# Altium schematic sheet BACKUP_Power.SchDoc
size A3; SheetNumber: 11; SheetTotal: 16
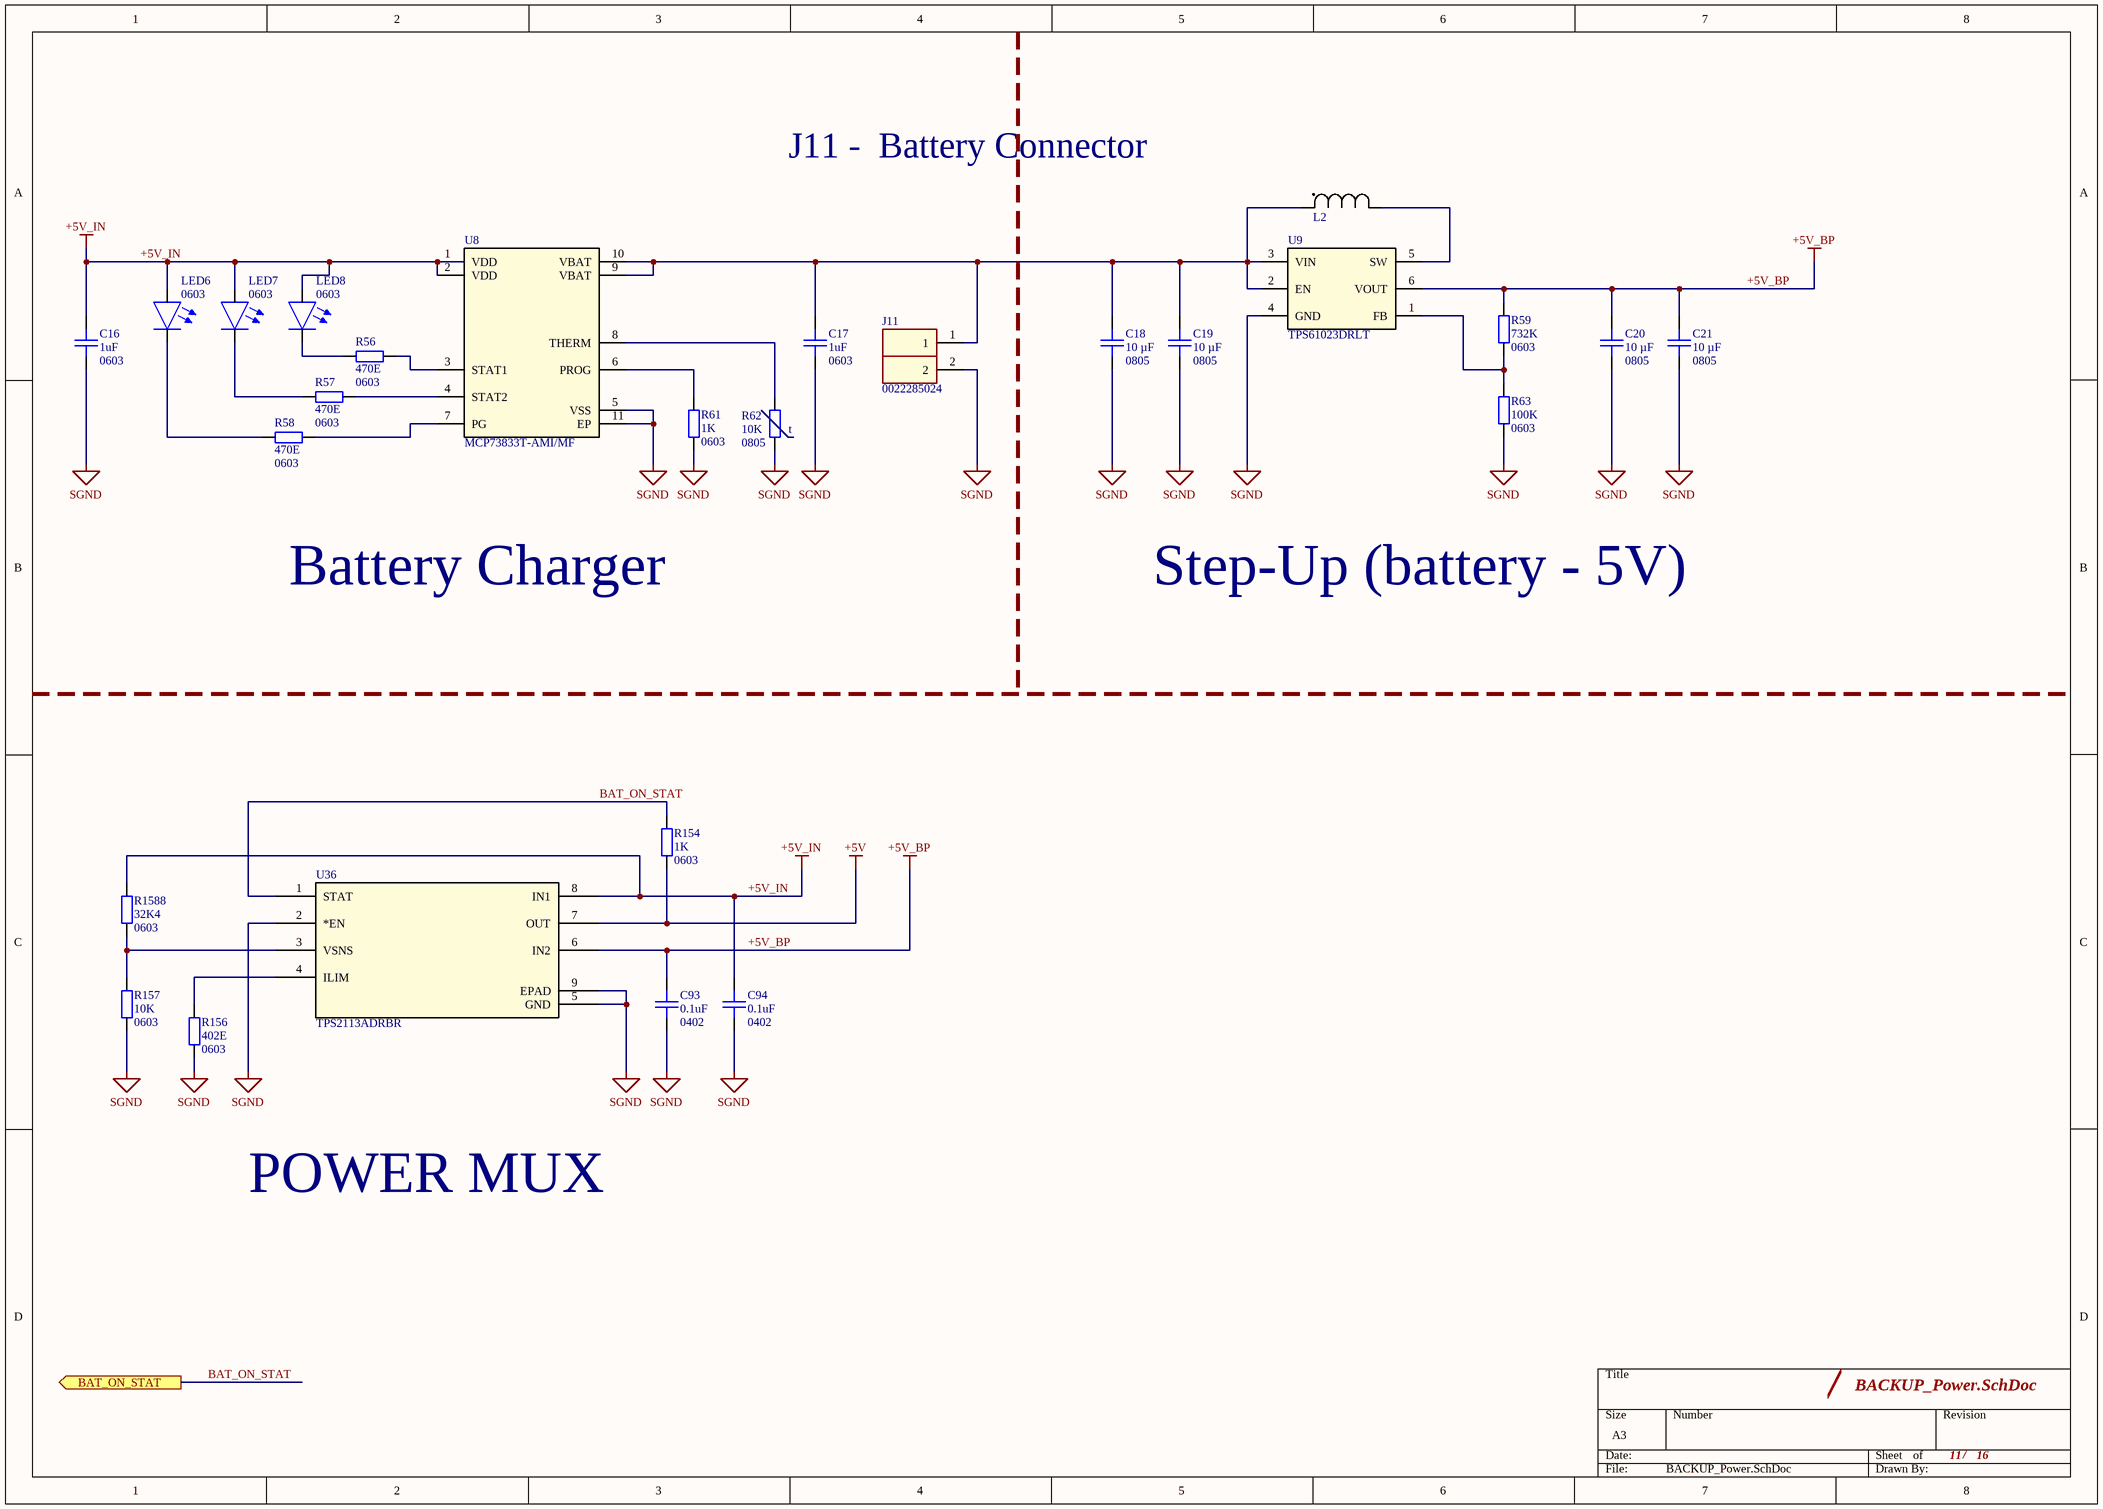
[diagram p0: BACKUP_Power.SchDoc]

## Parts
C16  Capacitance: 1uF  Size2: 0603  [CAPC160X80X90L35]  (hidden comment: KGM15AR71C105KT)
C17  Capacitance: 1uF  Size2: 0603  [CAPC160X80X90L35]  (hidden comment: KGM15AR71C105KT)
C18  Capacitance: 10 µF  Size2: 0805  [CAPC200X125X125L50]  (hidden comment: CC0805KKX5R8BB106)
C19  Capacitance: 10 µF  Size2: 0805  [CAPC200X125X125L50]  (hidden comment: CC0805KKX5R8BB106)
C20  Capacitance: 10 µF  Size2: 0805  [CAPC200X125X125L50]  (hidden comment: CC0805KKX5R8BB106)
C21  Capacitance: 10 µF  Size2: 0805  [CAPC200X125X125L50]  (hidden comment: CC0805KKX5R8BB106)
C93  Capacitance: 0.1uF  Package1: 0402  [CAPC100x50x50L25]  (hidden comment: 04023C104KAT2A)
C94  Capacitance: 0.1uF  Package1: 0402  [CAPC100x50x50L25]  (hidden comment: 04023C104KAT2A)
J11  0022285024  [PLS-02]
L2  XEL4030-101MEB  [IND_XEL4030_3.2_COC]  (value not drawn)
LED6  Size: 0603  [LED_0603(1608)]  (hidden comment: 150060GS75000)
LED7  Size: 0603  [LED_0603(1608)]  (hidden comment: 150060GS75000)
LED8  Size: 0603  [LED_0603(1608)]  (hidden comment: 150060GS75000)
R56  Resistance: 470E  Size2: 0603  [RESC160X80X55L30]  (hidden comment: RC0603FR-07470RL)
R57  Resistance: 470E  Size2: 0603  [RESC160X80X55L30]  (hidden comment: RC0603FR-07470RL)
R58  Resistance: 470E  Size2: 0603  [RESC160X80X55L30]  (hidden comment: RC0603FR-07470RL)
R59  Resistance: 732K  Size2: 0603  [RESC160X80X55L30]  (hidden comment: RC0603FR-07732KL)
R61  Resistance: 1K  Size2: 0603  [RESC160X80X55L30]  (hidden comment: RC0603FR-071KL)
R62  Resistance: 10K  Size2: 0805  [RESC200X125X60L40]  (hidden comment: NTCS0805E3103HMT)
R63  Resistance: 100K  Size2: 0603  [RESC160X80X55L30]  (hidden comment: RC0603FR-07100KL)
R154  Resistance: 1K  Size2: 0603  [RESC160X80X55L30]  (hidden comment: RC0603FR-071KL)
R156  Resistance: 402E  Size2: 0603  [RESC160X80X55L30]  (hidden comment: RC0603FR-07402RP)
R157  Resistance: 10K  Size2: 0603  [RESC160X80X55L30]  (hidden comment: RC0603FR-0710KL)
R1588  Resistance: 32K4  Size2: 0603  [RESC160X80X55L30]  (hidden comment: RC0603FR-0732K4L)
U8  MCP73833T-AMI/MF  [DFN10_3x3MC_MCH]
U9  TPS61023DRLT  [DRL0006A]
U36  TPS2113ADRBR  [DRB8_2P4X1P65]

## Ports
BAT_ON_STAT (out)

## Nets
+5V: R154.2 U36.7(OUT)
+5V_BP: C20.2 C21.2 C93.1 R59.1 U9.6(VOUT) U36.6(IN2)
+5V_IN: C16.2 C94.1 LED6.1(Anode) LED7.1(Anode) LED8.1(Anode) R1588.1 U8.1(VDD) U8.2(VDD) U36.8(IN1)
SGND: C16.1 C17.1 C18.1 C19.1 C20.1 C21.1 C93.2 C94.2 J11.2 R61.2 R62.1 R63.2 R156.2 R157.2 U8.5(VSS) U8.11(EP) U9.4(GND) U36.2(*EN) U36.5(GND) U36.9(EPAD)
BAT_ON_STAT: R154.1 U36.1(STAT) ; port BAT_ON_STAT
NetC17_2: C17.2 C18.2 C19.2 J11.1 L2.2 U8.9(VBAT) U8.10(VBAT) U9.2(EN) U9.3(VIN)
NetL2_1: L2.1 U9.5(SW)
NetLED6_2: LED6.2(Chatode) R58.2
NetLED7_2: LED7.2(Chatode) R57.2
NetLED8_2: LED8.2(Chatode) R56.2
NetR56_1: R56.1 U8.3(STAT1)
NetR57_1: R57.1 U8.4(STAT2)
NetR58_1: R58.1 U8.7(PG)
NetR59_2: R59.2 R63.1 U9.1(FB)
NetR61_1: R61.1 U8.6(PROG)
NetR62_2: R62.2 U8.8(THERM)
NetR156_1: R156.1 U36.4(ILIM)
NetR157_1: R157.1 R1588.2 U36.3(VSNS)

## Notes on the sheet
- J11 -  Battery Connector
- (near R62) t
- Battery Charger
- Step-Up (battery - 5V)
- POWER MUX
- /

## Library data of the parts
C16 C17 = CMP-00119-5: CAP CER 1UF 16V X7R 0603; Manufacturer: KYOCERA AVX; Op Temp min: -55°C; Op Temp max: 125°C; Tolerance: 10%; ComponentLink3URL: https://www.digikey.ee/en/products/detail/kyocera-avx/kgm15ar71c105kt/10815111; ComponentLink1Description: Datasheet; MPN: KGM15AR71C105KT; Lead Spacing: 0mm; Ratings: -; Size: 1.60mm x 0.80mm; ComponentLink1URL: https://datasheets.kyocera-avx.com/KGM_X7R.pdf; Package: 0603 (1608 Metric); Dielectric: X7R; ComponentLink3Description: Digikey; Voltage Rating: 16V; Height max: 900µm; Mounting Type: SM; Component Type: Ceramic Capacitor
C18-C21 = CMP-001-1415-2: CAP CER 10UF 25V X5R 0805; Manufacturer: YAGEO; Op Temp max: 125°C; Op Temp min: -55°C; Tolerance: ±10%; Voltage Rating: 25V; Mounting Type: SM; MPN: CC0805KKX5R8BB106; Package: 0805 (2012 Metric); Dielectric: X5R; ComponentLink3Description: Digikey; ComponentLink1Description: Datasheet; Component Type: Ceramic Capacitor
  C18 C20: ComponentLink1URL: https://www.yageo.com/upload/media/product/app/datasheet/mlcc/upy-gphc_x7r_6_3v-to-250v.pdf; ComponentLink3URL: https://www.digikey.ee/en/products/detail/yageo/cc0805krx7r9bb223/302872
  C19 C21: ComponentLink1URL: https://www.yageo.com/upload/media/product/app/datasheet/mlcc/upy-gphc_x5r_4v-to-50v.pdf; ComponentLink3URL: https://www.digikey.com/en/products/detail/yageo/CC0805KKX5R8BB106/5195275
C93 C94 = CMP-001-0374-4: 0402 25V X7R 100 NF 10%; Manufacturer: KYOCERA AVX; Op Temp max: 85°C; Op Temp min: -55°C; ComponentLink3URL: https://www.digikey.com/en/products/detail/yageo/CC0402MRX5R5BB106/5195138; MPN: 04023C104KAT2A; ComponentLink1URL: https://www.yageo.com/upload/media/product/productsearch/datasheet/mlcc/UPY-GPHC_X5R_4V-to-50V_26.pdf; Package: 0402 (1005 Metric); Size: 1.00mm x 0.50mm; Height max: 700µm; Mounting Type: SM; Tolerance: 10%; ComponentLink1Description: Datasheet; ComponentLink3Description: Digikey; Ratings: -; Dielectric: X7R; ComponentLink2Description: Mouser; ComponentLink2URL: https://eu.mouser.com/ProductDetail/YAGEO/CC0402MRX5R5BB106?qs=zEY9bCHj09eCmUJdZuS5Lg%3D%3D; Lead Spacing: 0mm; Component Type: Ceramic Capacitor; Voltage Rating: 25V
J11 = PLS_02: CONN HEADER VERT 2POS 2.54MM; MAnufacturer: MOLEX; MPN: 0022285024
L2 = XEL4030-101MEB: FIXED IND 1UH 10.7A 9.78MOHM SM; Mfr_Name: Coilcraft; Tolerance: ±20%; Inductance: 1 µH; DC Resistance (DCR): 9.78mOhm Max; Current Rating (Amps): 10.7 A; MPN: XEL4030-101MEB; ComponentLink1Description: DigiKey; ComponentLink1URL: https://www.digikey.com/en/products/detail/coilcraft/xel4030-102mec/21381728; ComponentLink2Description: Datasheet; ComponentLink2URL: https://www.coilcraft.com/en-us/files/datasheet/XEL4030
LED6-LED8 = LED_0603_SMD: LED GREEN CLEAR 0603 SMD; MPN: 150060GS75000; ComponentLink1Description: DigiKey; ComponentLink1URL: https://www.digikey.com/en/products/detail/w%C3%BCrth-elektronik/150060gs75000/4489898
R56-R58 = CMP-001-0628-7: RES 470 OHM 1% 1/10W 0603; Manufacturer: YAGEO; Power: 100mW; Temperature Coefficient: ±100ppm; Op Temp max: 155°C; Op Temp min: -55°C; Ratings: -; ComponentLink3URL: https://www.digikey.com/en/products/detail/yageo/RC0603FR-0710KL/726880?s=N4IgTCBcDaIEoGEAMA2JBmAYnAtEg7AIxIDSAMiALoC%2BQA; Size: 1.60mm x 0.80mm; ComponentLink1Description: Datasheet; ComponentLink3Description: Digikey; ComponentLink2Description: Mouser; ComponentLink1URL: https://www.yageo.com/upload/media/product/products/datasheet/rchip/PYu-RC_51_RoHS_P_4.pdf; Composition: Thick Film; Package: 0603 (1608 Metric); ComponentLink2URL: https://eu.mouser.com/ProductDetail/YAGEO/RC0603FR-0710KL?qs=grNVn54RoB%252B3GtjbJj3wJQ%3D%3D; Mounting Type: SM; Tolerance: 1%; Height max: 550µm; MPN: RC0603FR-07470RL; Component Type: Chip Resistor
R59 = CMP-001-0628-7: RES 732K OHM 1% 1/10W 0603; Manufacturer: YAGEO; Power: 100mW; Temperature Coefficient: ±100ppm; Op Temp max: 155°C; Op Temp min: -55°C; Ratings: -; ComponentLink3URL: https://www.digikey.com/en/products/detail/yageo/rc0603fr-07732kl/727376; Size: 1.60mm x 0.80mm; ComponentLink1Description: Datasheet; ComponentLink3Description: Digikey; ComponentLink1URL: https://www.digikey.ee/en/products/detail/yageo/rc0603fr-07100rp/4935304; Composition: Thick Film; Package: 0603 (1608 Metric); Mounting Type: SM; Tolerance: 1%; Height max: 550µm; MPN: RC0603FR-07732KL; Component Type: Chip Resistor
R61 R154 = CMP-001-0628-7: RES 1K OHM 1% 1/10W 0603; Manufacturer: YAGEO; Power: 100mW; Temperature Coefficient: ±100ppm; Op Temp max: 155°C; Op Temp min: -55°C; Ratings: -; ComponentLink3URL: https://www.digikey.com/en/products/detail/yageo/RC0603FR-0710KL/726880?s=N4IgTCBcDaIEoGEAMA2JBmAYnAtEg7AIxIDSAMiALoC%2BQA; Size: 1.60mm x 0.80mm; ComponentLink1Description: Datasheet; ComponentLink3Description: Digikey; ComponentLink1URL: https://www.digikey.ee/en/products/detail/yageo/rc0603fr-07100rp/4935304; Composition: Thick Film; Package: 0603 (1608 Metric); Mounting Type: SM; Tolerance: 1%; Height max: 550µm; MPN: RC0603FR-071KL; Component Type: Chip Resistor
R62 = CMP-001-0694-4: THERMISTOR NTC 10KOHM 3570K 0805; Manufacturer: Vishay Beyschlag/Draloric/BC Components; Op Temp max: 155°C; Tolerance: ±3%; Package: 0805 (2012 Metric); MPN: NTCS0805E3103HMT; ComponentLink1Description: Datasheet; ComponentLink3Description: Digikey; Mounting Type: SM; ComponentLink3URL: https://www.digikey.com/en/products/detail/vishay-beyschlag-draloric-bc-components/ntcs0805e3103hmt/2237369; ComponentLink1URL: https://www.vishay.com/docs/29044/ntcs0805e3t.pdf; Component Type: Chip Resistor
R63 = CMP-001-0628-7: RES 100K OHM 1% 1/10W 0603; Manufacturer: YAGEO; Power: 100mW; Temperature Coefficient: ±100ppm; Op Temp max: 155°C; Op Temp min: -55°C; Ratings: -; ComponentLink3URL: https://www.digikey.com/en/products/detail/yageo/rc0603fr-07100kl/726889; Size: 1.60mm x 0.80mm; ComponentLink1Description: Datasheet; ComponentLink3Description: Digikey; ComponentLink1URL: https://www.digikey.ee/en/products/detail/yageo/rc0603fr-07100rp/4935304; Composition: Thick Film; Package: 0603 (1608 Metric); Mounting Type: SM; Tolerance: 1%; Height max: 550µm; MPN: RC0603FR-07100KL; Component Type: Chip Resistor
R156 = CMP-001-0628-7: RES 402 OHM 1% 1/10W 0603; Manufacturer: YAGEO; Power: 100mW; Temperature Coefficient: ±100ppm; Op Temp max: 155°C; Op Temp min: -55°C; PMNT: DNP; Ratings: -; ComponentLink3URL: https://www.digikey.com/en/products/detail/yageo/RC0603FR-0710KL/726880?s=N4IgTCBcDaIEoGEAMA2JBmAYnAtEg7AIxIDSAMiALoC%2BQA; Size: 1.60mm x 0.80mm; ComponentLink1Description: Datasheet; ComponentLink3Description: Digikey; ComponentLink2Description: Mouser; ComponentLink1URL: https://www.yageo.com/upload/media/product/products/datasheet/rchip/PYu-RC_51_RoHS_P_4.pdf; Composition: Thick Film; Package: 0603 (1608 Metric); ComponentLink2URL: https://eu.mouser.com/ProductDetail/YAGEO/RC0603FR-0710KL?qs=grNVn54RoB%252B3GtjbJj3wJQ%3D%3D; Mounting Type: SM; Tolerance: 1%; Height max: 550µm; MPN: RC0603FR-07402RP; Component Type: Chip Resistor
R157 = CMP-001-0628-7: RES 10K OHM 1% 1/10W 0603; Manufacturer: YAGEO; Power: 100mW; Temperature Coefficient: ±100ppm; Op Temp max: 155°C; Op Temp min: -55°C; PMNT: DNP; Ratings: -; ComponentLink3URL: https://www.digikey.com/en/products/detail/yageo/RC0603FR-0710KL/726880?s=N4IgTCBcDaIEoGEAMA2JBmAYnAtEg7AIxIDSAMiALoC%2BQA; Size: 1.60mm x 0.80mm; ComponentLink1Description: Datasheet; ComponentLink3Description: Digikey; ComponentLink2Description: Mouser; ComponentLink1URL: https://www.yageo.com/upload/media/product/products/datasheet/rchip/PYu-RC_51_RoHS_P_4.pdf; Composition: Thick Film; Package: 0603 (1608 Metric); ComponentLink2URL: https://eu.mouser.com/ProductDetail/YAGEO/RC0603FR-0710KL?qs=grNVn54RoB%252B3GtjbJj3wJQ%3D%3D; Mounting Type: SM; Tolerance: 1%; Height max: 550µm; MPN: RC0603FR-0710KL; Component Type: Chip Resistor
R1588 = CMP-001-0628-7: RES 32.4K OHM 1% 1/10W 0603; Manufacturer: YAGEO; Power: 100mW; Temperature Coefficient: ±100ppm; Op Temp max: 155°C; Op Temp min: -55°C; PMNT: DNP; Ratings: -; ComponentLink3URL: https://www.digikey.com/en/products/detail/yageo/RC0603FR-0710KL/726880?s=N4IgTCBcDaIEoGEAMA2JBmAYnAtEg7AIxIDSAMiALoC%2BQA; Size: 1.60mm x 0.80mm; ComponentLink1Description: Datasheet; ComponentLink3Description: Digikey; ComponentLink2Description: Mouser; ComponentLink1URL: https://www.yageo.com/upload/media/product/products/datasheet/rchip/PYu-RC_51_RoHS_P_4.pdf; Composition: Thick Film; Package: 0603 (1608 Metric); ComponentLink2URL: https://eu.mouser.com/ProductDetail/YAGEO/RC0603FR-0710KL?qs=grNVn54RoB%252B3GtjbJj3wJQ%3D%3D; Mounting Type: SM; Tolerance: 1%; Height max: 550µm; MPN: RC0603FR-0732K4L; Component Type: Chip Resistor
U8 = MCP73833T-AMIMF: IC BATT CONTRL LI-ION 1CEL 10DFN; Mfr_Name: Microchip; Voltage - Supply (Max): 6V; Battery Pack Voltage: 4.2V; Charge Current - Max: 1.1A; MPN: MCP73833T-AMI/MF
U9 = TPS61023DRLT: IC REG BOOST ADJ 3A SOT563; Mfr_Name: Texas Instruments; Voltage - Input (Min): 0.5V; Voltage - Input (Max): 5.5V; Frequency - Switching: 1MHz; Current - Output: 3A; Manufacturer_Part_Number: TPS61023DRLT; ComponentLink1Description: DigiKey; ComponentLink1URL: https://www.digikey.com/en/products/detail/texas-instruments/tps61023drlt/11310622; ComponentLink2Description: Datasheet; ComponentLink2URL: https://www.ti.com/general/docs/suppproductinfo.tsp?distId=10&gotoUrl=https%3A%2F%2Fwww.ti.com%2Flit%2Fgpn%2Ftps61023
U36 = TPS2113ADRBR: IC OR CTRLR SRC SELECT 8SON; Mfr_Name: Texas Instruments; Current - Output (Max): 1.25A; Voltage - Supply: 2.8V ~ 5.5V; MPN: TPS2113ADRBR; Type: Source Selector Switch; ComponentLink1Description: DigiKey; ComponentLink1URL: https://www.digikey.com/en/products/detail/texas-instruments/TPS2113ADRBR/2353703?s=N4IgTCBcDaICoAUDKYCMqDMBBAIgJQCE8QBdAXyA; ComponentLink2Description: Datasheet; ComponentLink2URL: https://www.ti.com/general/docs/suppproductinfo.tsp?distId=10&gotoUrl=https%3A%2F%2Fwww.ti.com%2Flit%2Fgpn%2Ftps2113a